# EasyEDA Pro project fei1554973967-sw3538-dff8db20.epro, schematic 充电板
Board Name: Board1; Create Date: 2025-04-01; Page Name: P1; Project Name: SW3538; Schematic Name: Schematic1; Update Date: 2025-04-10; Company: 嘉立创EDA; Page Size: A4; Version: V1.0
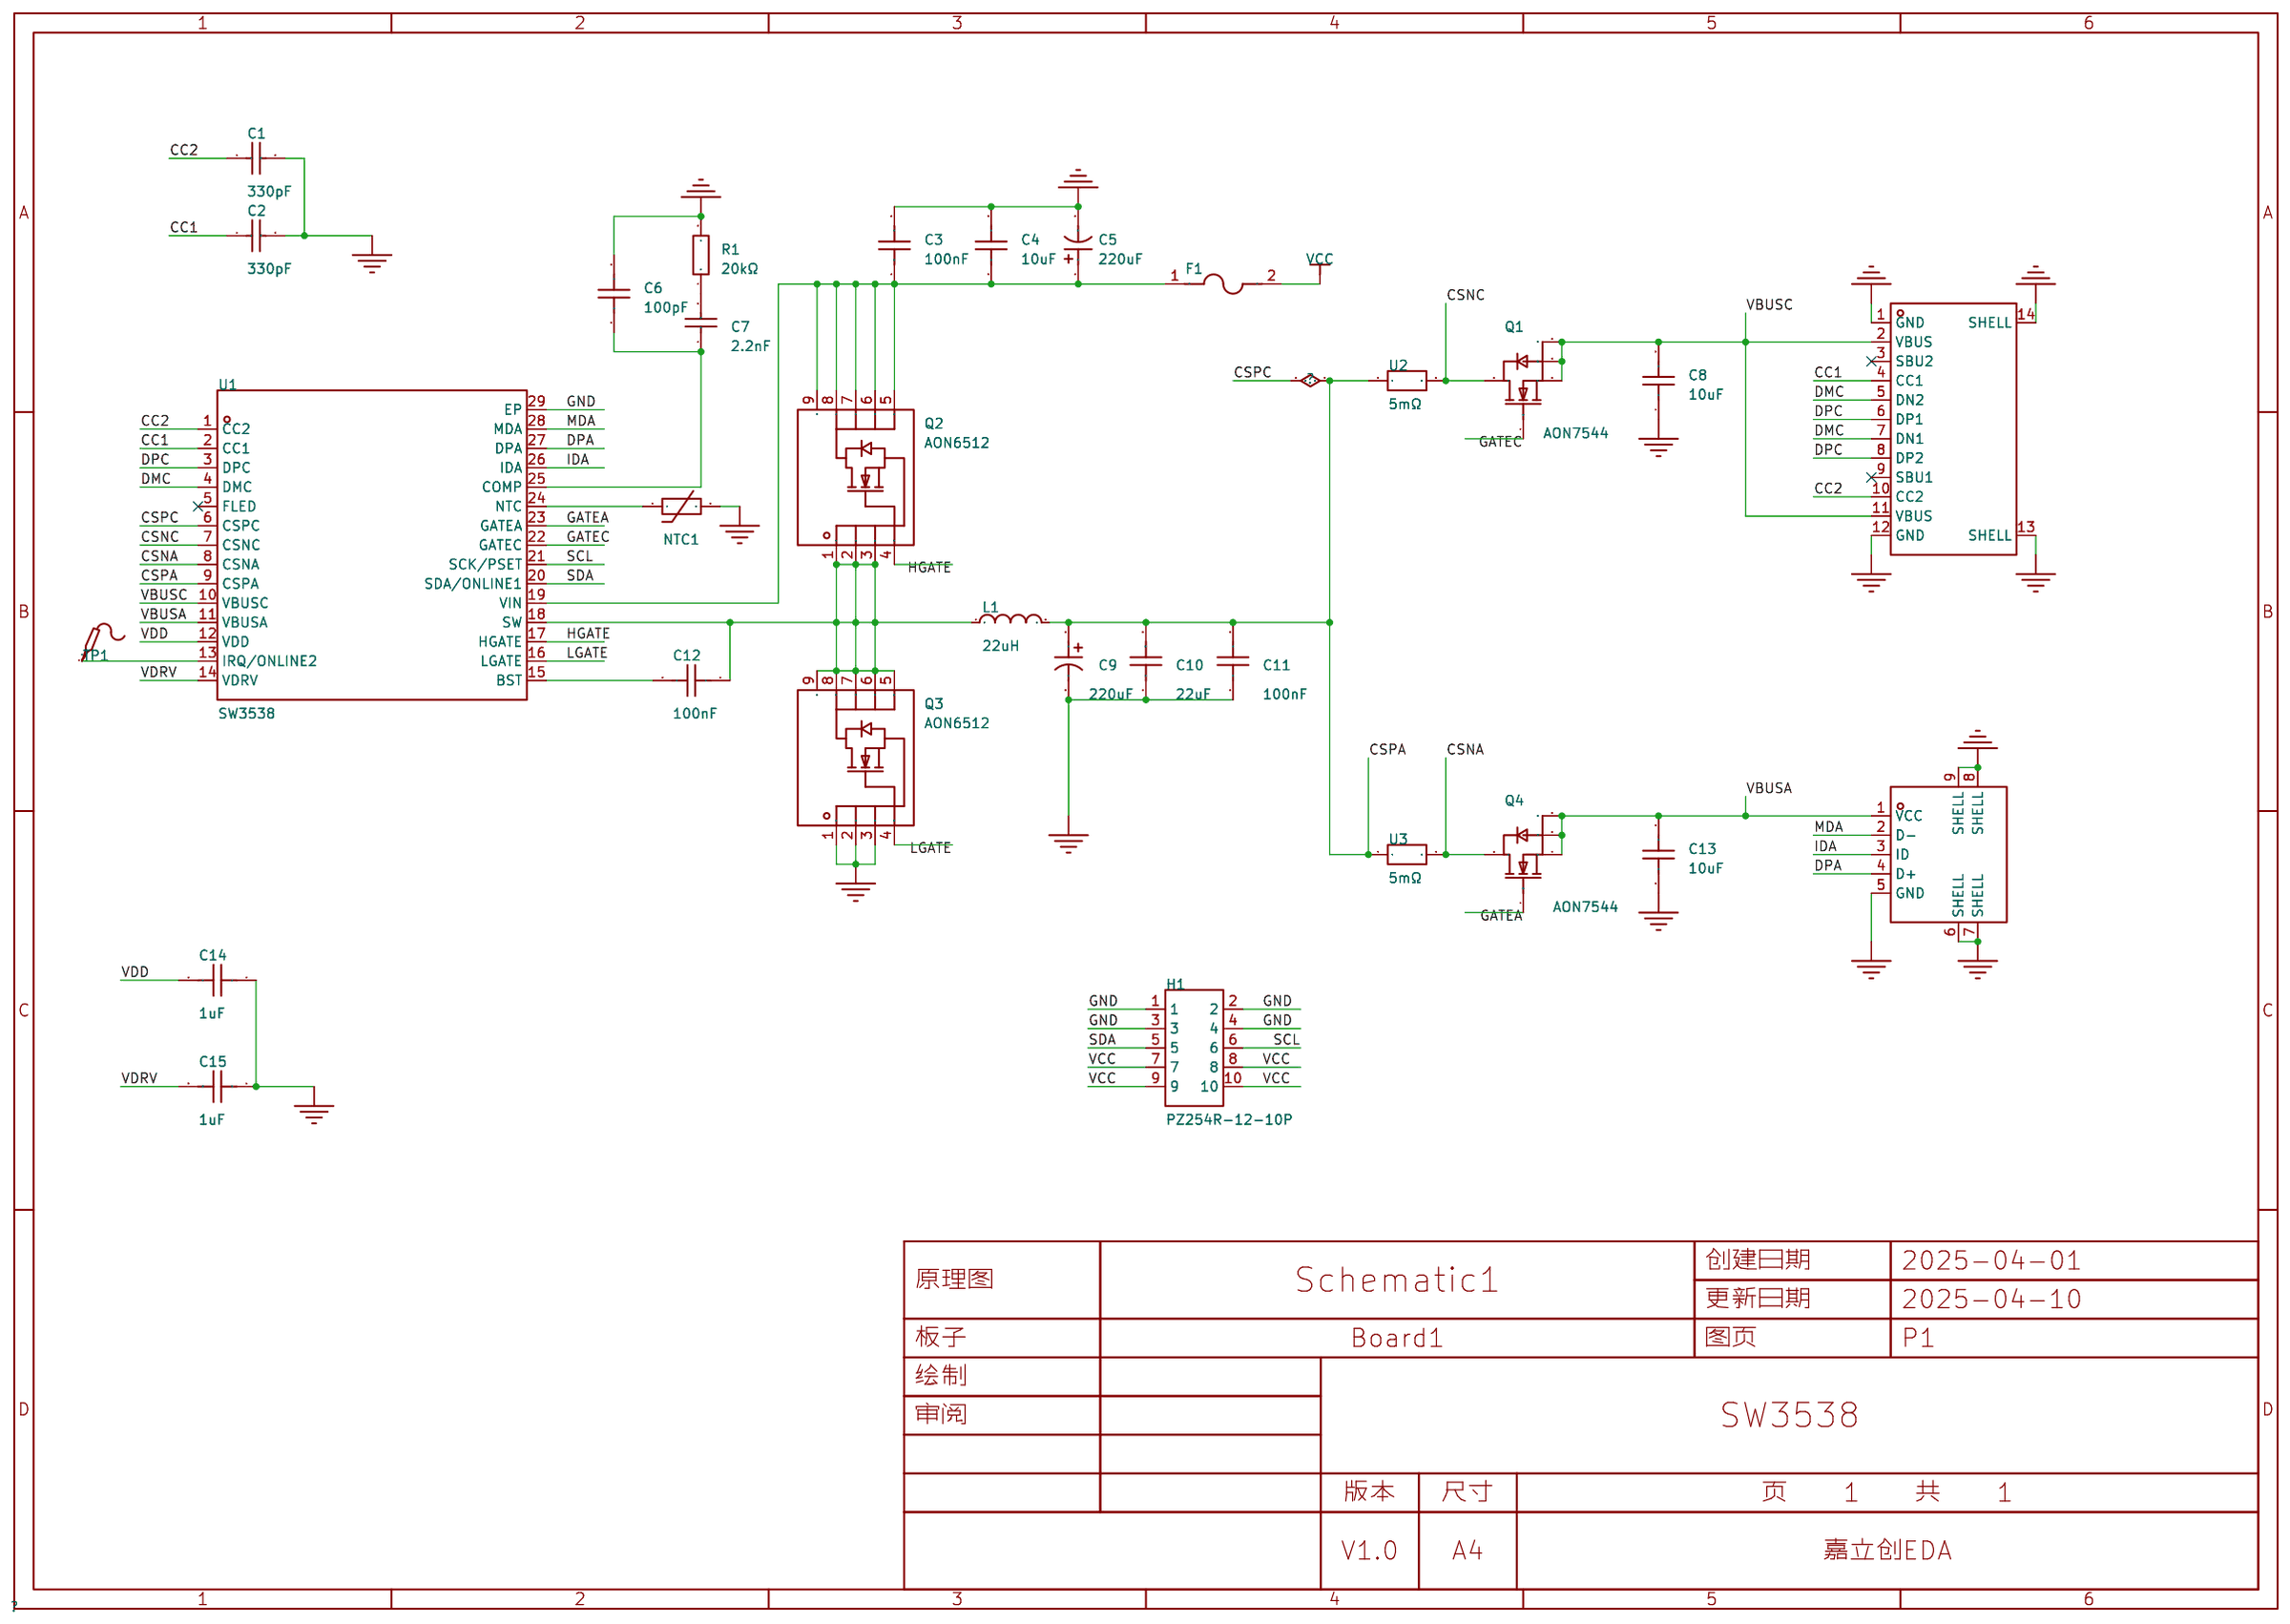
[diagram p0: schematic sheet]

## Parts
C1  330pF  [C0603]
C2  330pF  [C0603]
C3  100nF  [C0603]
C4  10uF  [C0603]
C5  220uF  [CAP-TH_BD6.3-P2.50-D1.0-FD]
C6  100pF  [C0603]
C7  2.2nF  [C0603]
C8  10uF  [C0603]
C9  220uF  [CAP-TH_BD6.3-P2.50-D1.0-FD]
C10  22uF  [C0805]
C11  100nF  [C0603]
C12  100nF  [C0603]
C13  10uF  [C0603]
C14  1uF  [C0603]
C15  1uF  [C0603]
F1  JFC1206-1500FS  [F1206]
H1  PZ254R-12-10P  [HDR-TH_10P-P2.54-H-M-R2-C5-S2.54]
L1  22uH  [IND-TH_BD15.5-P4.00-D0.8_XR050125TS221MHL5]
NTC1  SDNT1608X104F3950FTF  [R0603]
Q1  AON7544  [DFN-8_L3.3-W3.3-P0.65-BL-2]
Q2  AON6512  [PDFN-8_L5.6-W5.2-P1.27-LS6.1-BL]
Q3  AON6512  [PDFN-8_L5.6-W5.2-P1.27-LS6.1-BL]
Q4  AON7544  [DFN-8_L3.3-W3.3-P0.65-BL-2]
R1  20kΩ  [R0805]
TP1  -  [Test-Point-0.5mm]
U1  SW3538  [QFN-28_L4.0-W4.0-P0.40-TL-EP2.4]
U2  5mΩ  [R1206]
U3  5mΩ  [R1206]
USB1  TYPE-C 16PIN 2MD(073)  [USB-C-SMD_TYPE-C-6PIN-2MD-073]
USB2  U234-051N-3GRA035-5  [USB-A-TH_U234-051N-3GRA03]

## Library data of the parts
C1 C2 = CL10C331JB8NNNC: 容值:330pF;精度:±5%;额定电压:50V;材质(温度系数):C0G;; LCSC Part Name: 330pF ±5% 50V; Supplier Part: C1664; Manufacturer: SAMSUNG(三星); Supplier Footprint: 0603; JLCPCB Part Class: 基础库; Datasheet: https://atta.szlcsc.com/upload/public/pdf/source/20160218/1457707763339.pdf; Supplier: LCSC; Tolerance: ±5%; Voltage Rated: 50V; Temperature Coefficient: C0G
C3 C11 C12 = CGA0603X7R104K500JT: 容值:100nF;精度:±10%;额定电压:50V;温度系数:X7R;; LCSC Part Name: 100nF ±10% 50V; Supplier Part: C6119867; Manufacturer: HRE(芯声); Supplier Footprint: 0603; JLCPCB Part Class: 扩展库; Datasheet: https://atta.szlcsc.com/upload/public/pdf/source/20250103/C44077DA9E7B3EFAE02F22B6D3D1CBC9.pdf; Supplier: LCSC; Tolerance: ±10%; Voltage Rating: 50V; Temperature Coefficient: X7R
C4 C8 C13 = GRM188R6YA106MA73D: 容值:10uF;精度:±20%;额定电压:35V;材质(温度系数):X5R;; LCSC Part Name: 10uF ±20% 35V; Supplier Part: C194427; Manufacturer: muRata(村田); Supplier Footprint: 0603; JLCPCB Part Class: 扩展库; Datasheet: https://atta.szlcsc.com/upload/public/pdf/source/20210128/C194427_FCA3640823207DDB58700A82F1A19B5F.pdf; Supplier: LCSC; Tolerance: ±20%; Voltage Rated: 35V; Temperature Coefficient: X5R
C5 C9 = SPT1VM221E12OR: 容值:220uF;精度:±20%;额定电压:35V;纹波电流:-;等效串联电阻(ESR):-;类型:-;; LCSC Part Name: 220uF ±20% 35V; Supplier Part: C698172; Manufacturer: Yunxing(云星); Supplier Footprint: 插件,D6.3xL12mm; JLCPCB Part Class: 扩展库; Datasheet: https://atta.szlcsc.com/upload/public/pdf/source/20200709/C697725_42901235359D2F905A7BBBDFFA1D5D23.pdf; Supplier: LCSC; Tolerance: ±20%; Voltage Rating: 35V; Pin Spacing: 2.5mm; Diameter: 6.3mm; Height - Seated (Max): 12mm; Lifetime: 2000hrs@105℃; Operating Temperature: -55℃~+105℃
C6 = CC0603JRNPO9BN101: 容值:100pF;精度:±5%;额定电压:50V;材质(温度系数):NP0;; LCSC Part Name: 100pF ±5% 50V; Supplier Part: C14665; Manufacturer: YAGEO(国巨); Supplier Footprint: 0603; JLCPCB Part Class: 扩展库; Datasheet: https://atta.szlcsc.com/upload/public/pdf/source/20181008/C309499_21CC21451B82C39E3D92150FD6B30293.pdf; Supplier: LCSC; Tolerance: ±5%; Voltage Rated: 50V; Temperature Coefficient: NP0
C7 = CC0603KRX7R9BB222: 容值:2.2nF;精度:±10%;额定电压:50V;材质(温度系数):X7R;; LCSC Part Name: 2.2nF ±10% 50V; Supplier Part: C107082; Manufacturer: YAGEO(国巨); Supplier Footprint: 0603; JLCPCB Part Class: 扩展库; Datasheet: https://atta.szlcsc.com/upload/public/pdf/source/20180910/C282072_33301C7F631E79921B82A8DAC6BCC5B3.pdf; Supplier: LCSC; Tolerance: ±10%; Voltage Rated: 50V; Temperature Coefficient: X7R
C10 = CGA0805X5R226M350MT: 容值:22uF;精度:±20%;额定电压:35V;材质(温度系数):X5R;; LCSC Part Name: 22uF ±20% 35V; Supplier Part: C6119901; Manufacturer: HRE(芯声); Supplier Footprint: 0805; JLCPCB Part Class: 扩展库; Datasheet: https://atta.szlcsc.com/upload/public/pdf/source/20231129/D589D0CC4D260F7AC3A77E53B455CCB3.pdf; Supplier: LCSC; Tolerance: ±20%; Voltage Rated: 35V; Temperature Coefficient: X5R
C14 C15 = CL10A105KB8NNNC: 容值:1uF;精度:±10%;额定电压:50V;材质(温度系数):X5R;; LCSC Part Name: 1uF ±10% 50V; Supplier Part: C15849; Manufacturer: SAMSUNG(三星); Supplier Footprint: 0603; JLCPCB Part Class: 基础库; Datasheet: https://atta.szlcsc.com/upload/public/pdf/source/20160218/1457707763339.pdf; Supplier: LCSC; Tolerance: ±10%; Voltage Rated: 50V; Temperature Coefficient: X5R
F1 = JFC1206-1500FS: 类型:贴片式保险丝;额定电流:5A;额定电压 (AC):32V;额定电压:32V;分断能力:50A;; LCSC Part Name: 5A 32V 贴片式保险丝 快断; Supplier Part: C136351; Manufacturer: JDTfuse(集电通); Supplier Footprint: 1206; JLCPCB Part Class: 扩展库; Datasheet: https://atta.szlcsc.com/upload/public/pdf/source/20230515/8A56624F973AA51D74CDD59D07A1FF42.pdf; Supplier: LCSC; Type: 贴片式保险丝; Current Rating: 5A; Voltage Rating (AC): 32V; Voltage Rating (DC): 32V; Operating Temperature: -55℃~+125℃; Interrupt Rating: 50A
H1 = PZ254R-12-10P: 插针结构:2x5P;间距:2.54mm;行距:2.54mm;圆针/方针:方针;安装方式:弯插;排数:双排;总PIN位数:10P;额定电流:-;额定电压:-;配合针长度:6mm;塑高:2.5mm;触头材质:黄铜;触头镀层:-;工作温度:-40℃~+105℃;颜色:黑色;; LCSC Part Name: 2x5P 间距:2.54mm 方针 弯插; Supplier Part: C492433; Manufacturer: XFCN(兴飞); Supplier Footprint: 弯插,P=2.54mm; JLCPCB Part Class: 扩展库; Datasheet: https://atta.szlcsc.com/upload/public/pdf/source/20200309/C492433_E1DF9BC45CD746DC26B2517D82EEBDA7.pdf; Supplier: LCSC; Pin Structure: 2x5P; Pitch: 2.54mm; Row Spacing: 2.54mm; Circluar Pins/Square Pins: 方针; Mounting Type: 弯插; Number of Rows: 双排; Number of Pins: 10P; Length of Mating Pin: 6mm; Insulation Height: 2.5mm; Contact Material: 黄铜; Operating Temperature: -40℃~+105℃; Color: 黑色
L1 = XR050125TS220MH1L: 电感值:22uH;精度:±10%;额定电流:5A;类型:磁环电感;; LCSC Part Name: 带热缩套管; Supplier Part: C22358449; Manufacturer: XR(祥如); Supplier Footprint: 插件,D=15.5mm; JLCPCB Part Class: 扩展库; Datasheet: https://atta.szlcsc.com/upload/public/pdf/source/20240313/D3359ED321EC9FFFDE10A1A8BFBDBE25.pdf; Supplier: LCSC; Tolerance: ±10%; Current Rating: 5A; Type: 磁环电感; Wire Diameter: 1mm
NTC1 = SDNT1608X104F3950FTF: 阻值:100kΩ;B值(25℃/50℃):3950K;电阻精度:±1%;功率:100mW;B值精度:±1%;最大稳态电流(25℃):100uA;; Supplier Part: C919169; Manufacturer: Sunlord(顺络); Supplier Footprint: 0603; JLCPCB Part Class: 扩展库; Datasheet: https://atta.szlcsc.com/upload/public/pdf/source/20210916/BF106A3565EDFEB141CB3E0EA3A661F8.pdf; Supplier: LCSC; Resistance @ 25℃: 100kΩ; B Constant (25℃/50℃): 3950K; Resistance Tolerance: ±1%; Power: 100mW; B Constant Tolerance: ±1%; Steady State Current (Max): 100uA; Operating Temperature: -55℃~+125℃
Q1 Q4 = AON7544: 类型:1个N沟道;漏源电压(Vdss):30V;连续漏极电流(Id):30A;导通电阻(RDS(on)@Vgs,Id):8.5mΩ@4.5V,20A;功率(Pd):3W;阈值电压(Vgs(th)@Id):1.2V@250uA;; LCSC Part Name: 1个N沟道 耐压:30V 电流:30A; Supplier Part: C315567; Manufacturer: AOS; Supplier Footprint: DFN-8(3x3); JLCPCB Part Class: 扩展库; Datasheet: https://atta.szlcsc.com/upload/public/pdf/source/20190614/C315567_E434D67BCCEB23ABC813CC1BF26EA614.pdf; Supplier: LCSC; Type: 1个N沟道; Drain Source Voltage (Vdss): 30V; Continuous Drain Current (Id): 30A; Drain Source On Resistance (RDS(on)@Vgs,Id): 8.5mΩ@4.5V,20A; Power Dissipation (Pd): 3W; Gate Threshold Voltage (Vgs(th)@Id): 1.2V@250uA; Total Gate Charge (Qg@Vgs): 22.5nC@10V; Input Capacitance (Ciss@Vds): 951pF; Reverse Transfer Capacitance (Crss@Vds): 157pF; Operating Temperature: -55℃~+150℃
Q2 Q3 = AON6512: 类型:1个N沟道;漏源电压(Vdss):30V;连续漏极电流(Id):54A;功率(Pd):7.4W;导通电阻(RDS(on)@Vgs,Id):1.7mΩ@10V,20A;阈值电压(Vgs(th)@Id):2V@250uA;; LCSC Part Name: 1个N沟道 耐压:30V 电流:54A; Supplier Part: C485679; Manufacturer: AOS; Supplier Footprint: PDFN-8(5.2x5.6); JLCPCB Part Class: 扩展库; Datasheet: https://atta.szlcsc.com/upload/public/pdf/source/20200117/C485679_8C827D3BD1FB0F648243EFEDB9DCD98E.pdf; Supplier: LCSC; Type: 1个N沟道; Drain Source Voltage (Vdss): 30V; Continuous Drain Current (Id): 54A; Power Dissipation (Pd): 7.4W; Drain Source On Resistance (RDS(on)@Vgs,Id): 1.7mΩ@10V,20A; Gate Threshold Voltage (Vgs(th)@Id): 2V@250uA
R1 = 0805W8F2002T5E: 电阻类型:厚膜电阻;阻值:20kΩ;精度:±1%;功率:125mW;最大工作电压:150V;温度系数:±100ppm/℃;; LCSC Part Name: 20kΩ ±1% 125mW 厚膜电阻; Supplier Part: C4328; Manufacturer: UNI-ROYAL(厚声); Supplier Footprint: 0805; JLCPCB Part Class: 基础库; Datasheet: https://atta.szlcsc.com/upload/public/pdf/source/20200306/C422600_1E6D84923E4A46A82E41ADD87F860B5C.pdf; Supplier: LCSC; Type: 厚膜电阻; Tolerance: ±1%; Power(Watts): 125mW; Overload Voltage (Max): 150V; Temperature Coefficient: ±100ppm/℃; Operating Temperature Range: -55℃~+155℃
TP1 = Test-Point: Test Point 测试点
U1 = SW3538: Supplier Part: C9900059493; Supplier Footprint: QFN28 4X4; Supplier: LCSC
U2 U3 = HoLLR1206-1W-5mR-1%: 电阻类型:采样电阻;阻值:5mΩ;精度:±1%;额定压降:-;功率:1W;温度系数:±50ppm/℃;安装方式:贴片;; LCSC Part Name: 5mΩ ±1% 1W; Supplier Part: C2988648; Manufacturer: Milliohm(毫欧); Supplier Footprint: 1206; JLCPCB Part Class: 扩展库; Datasheet: https://atta.szlcsc.com/upload/public/pdf/source/20220407/F189C92CC2C10DCB4BF36375122B9E11.pdf; Supplier: LCSC; Type: 采样电阻; Tolerance: ±1%; Power(Watts): 1W; Rated Current: 31.6A; Temperature Coefficient: ±50ppm/℃; Mounting Sytle: 贴片
USB1 = TYPE-C 16PIN 2MD(073): 连接器类型:Type-C;标准:USB 3.1;公母:母;安装方式:卧贴;触点数量:16P;端口数量:1;额定电流 - 电源:5A;工作温度范围:-25℃~+85℃;; LCSC Part Name: Type-C 母 卧贴; Supplier Part: C2765186; Manufacturer: SHOU HAN(首韩); Supplier Footprint: SMD; JLCPCB Part Class: 扩展库; Datasheet: https://atta.szlcsc.com/upload/public/pdf/source/20211123/39B17C16241EAC15C5E277BDA434118E.pdf; Supplier: LCSC; Connector Type: Type-C; Standard: USB 3.1; Gender: 母; Mounting Style: 卧贴; Number of Contacts: 16P; Number of Ports: 1; Current Rating - Power (Max): 5A; Operating Temperature Range: -25℃~+85℃; Rated Voltage (Max): 5V; Connect-Disconnect Life: 5千次; Core Colour: 黑色
USB2 = U234-051N-3GRA035-5: 连接器类型:Type-A;标准:-;公母:母;安装方式:-;触点数量:5P;端口数量:1;额定电流 - 电源:4A;触头材质:黄铜;触头镀层:金;工作温度范围:-25℃~+85℃;焊接温度(最大值):235℃;; LCSC Part Name: Type-A 母; Supplier Part: C381138; Manufacturer: XKB Connection(中国星坤); Supplier Footprint: 插件; JLCPCB Part Class: 扩展库; Datasheet: https://atta.szlcsc.com/upload/public/pdf/source/20211015/A409A977E7A5E8D75052759067507BA4.pdf; Supplier: LCSC; Connector Type: Type-A; Gender: 母; Number of Contacts: 5P; Number of Ports: 1; Current Rating - Power (Max): 4A; Contact Material: 黄铜; Contact Plating: 金; Operating Temperature Range: -25℃~+85℃; Soldering Temperature(Max): 235℃

## Nets
GND: C1.2 C2.2 C3.2 C4.2 C5.2 C6.2 C8.1 C9.2 C10.1 C11.1 C13.1 C14.1 C15.1 H1.1 H1.2 H1.3 H1.4 NTC1.2 Q3.1(S) Q3.2(S) Q3.3(S) R1.2 U1.29(EP) USB1.1(GND) USB1.12(GND) USB1.13(SHELL) USB1.14(SHELL) USB2.5(GND) USB2.6(SHELL) USB2.7(SHELL) USB2.8(SHELL) USB2.9(SHELL)
VBUSA: C13.2 Q4.1(S) Q4.2(S) Q4.3(S) U1.11(VBUSA) USB2.1(VCC)
VBUSC: C8.2 Q1.1(S) Q1.2(S) Q1.3(S) U1.10(VBUSC) USB1.2(VBUS) USB1.11(VBUS)
VCC: F1.2 H1.7 H1.8 H1.9 H1.10
VDD: C14.2 U1.12(VDD)
CC1: C2.1 U1.2(CC1) USB1.4(CC1)
CC2: C1.1 U1.1(CC2) USB1.10(CC2)
CSNA: Q4.5(D) U1.8(CSNA) U3.2
CSNC: Q1.5(D) U1.7(CSNC) U2.2
CSPA: C9.1 C10.2 C11.2 L1.2 U1.6(CSPC) U1.9(CSPA) U2.1 U3.1
DMC: U1.4(DMC) USB1.5(DN2) USB1.7(DN1)
DPA: U1.27(DPA) USB2.4(D+)
DPC: U1.3(DPC) USB1.6(DP1) USB1.8(DP2)
GATEA: Q4.4(G) U1.23(GATEA)
GATEC: Q1.4(G) U1.22(GATEC)
HGATE: Q2.4(G) U1.17(HGATE)
IDA: U1.26(IDA) USB2.3(ID)
LGATE: Q3.4(G) U1.16(LGATE)
MDA: U1.28(MDA) USB2.2(D-)
SCL: H1.6 U1.21(SCK/PSET)
SDA: H1.5 U1.20(SDA/ONLINE1)
VDRV: C15.2 U1.14(VDRV)
$1N3322: C12.1 L1.1 Q2.1(S) Q2.2(S) Q2.3(S) Q3.5(D) Q3.6(D) Q3.7(D) Q3.8(D) Q3.9(D) U1.18(SW)
$1N3570: C12.2 U1.15(BST)
$1N3598: C7.2 R1.1
$1N3607: C6.1 C7.1 U1.25(COMP)
$1N3653: NTC1.1 U1.24(NTC)
$1N3771: C3.1 C4.1 C5.1 F1.1 Q2.5(D) Q2.6(D) Q2.7(D) Q2.8(D) Q2.9(D) U1.19(VIN)
$1N9417: TP1.1 U1.13(IRQ/ONLINE2)

Not connected (* = marked no-connect by the designer): U1 5(FLED)*; USB1 3(SBU2)* 9(SBU1)*
